# Altium schematic sheet ar_sch.SchDoc
size A4; SheetNumber: 1; SheetTotal: 1
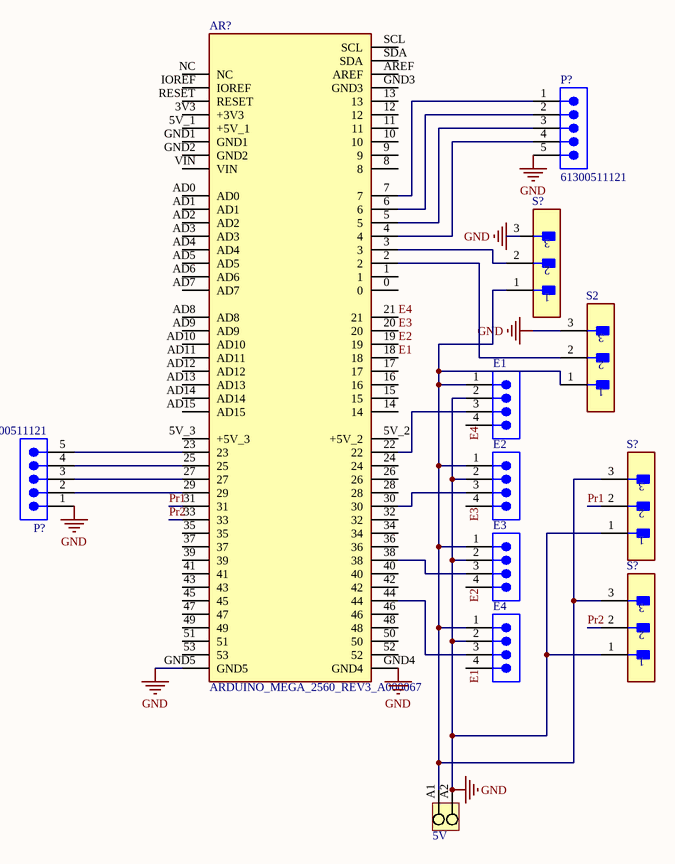
[diagram p0: ar_sch.SchDoc]

## Parts
(Parts that share a designator on the sheet are numbered #1, #2 ... from top to bottom, then left to right.)
5V  1715310000  [LM_5_00_90_02]  (value not drawn)
AR?  ARDUINO_MEGA_2560_REV3_A000067  [MODULE_A000067]
E1  encoder1  [61300411121]  (value not drawn)
E2  encoder2  [61300411121]  (value not drawn)
E3  encoder3  [61300411121]  (value not drawn)
E4  encoder4  [61300411121]  (value not drawn)
P?#1  61300511121  [61300511121]
P?#2  61300511121  [61300511121]
S2  22-11-1031  [FP-0022111031-MFG]  (value not drawn)
S?#1  22-11-1031  [FP-0022111031-MFG]  (value not drawn)
S?#2  22-11-1031  [FP-0022111031-MFG]  (value not drawn)
S?#3  22-11-1031  [FP-0022111031-MFG]  (value not drawn)

## Nets
GND: 5V.A2 AR?.GND4 AR?.GND5 E1.2 E2.2 E3.2 E4.2 P?#1.5 P?#2.1 S2.3 S?#1.3 S?#2.1 S?#3.1
E1: AR?.18 E4.4
E2: AR?.19 E3.4
E3: AR?.20 E2.4
E4: AR?.21 E1.4
Pr1: AR?.31 S?#2.2
Pr2: AR?.33 S?#3.2
Net5V_A1: 5V.A1 E1.1 E2.1 E3.1 E4.1 S2.1 S?#1.1 S?#2.3 S?#3.3
NetAR?_2: AR?.2 S2.2
NetAR?_3: AR?.3 S?#1.2
NetAR?_4: AR?.4 P?#1.4
NetAR?_5: AR?.5 P?#1.3
NetAR?_6: AR?.6 P?#1.2
NetAR?_7: AR?.7 P?#1.1
NetAR?_22: AR?.22 E1.3
NetAR?_23: AR?.23 P?#2.5
NetAR?_25: AR?.25 P?#2.4
NetAR?_27: AR?.27 P?#2.3
NetAR?_29: AR?.29 P?#2.2
NetAR?_30: AR?.30 E2.3
NetAR?_38: AR?.38 E3.3
NetAR?_44: AR?.44 E4.3

Not connected (* = marked no-connect by the designer): AR? 0 1 3V3(+3V3) 5V_1(+5V_1) 5V_2(+5V_2) 5V_3(+5V_3) 8 9 10 11 12 13 14 15 16 17 24 26 28 32 34 35 36 37 39 40 41 42 43 45 46 47 48 49 50 51 52 53 AD0 AD1 AD2 AD3 AD4 AD5 AD6 AD7 AD8 AD9 AD10 AD11 AD12 AD13 AD14 AD15 AREF GND1 GND2 GND3 IOREF NC RESET SCL SDA VIN

## Library data of the parts
5V = CMP-1559-01745-1: OMNIMATE Signal - series LM; Manufacturer: Weidmueller; Contact_material: Cu-Leg; Contact_surface: tinned; Solder_pin_length_mm: 3,5 mm; Rated_voltage_for_surge_voltage_class_pollution_degree_II_2: 630 V; Short_text_for_material: LM 5.00/02/90 3.5SN OR BX; Pitch_inch: 0,197 inch; Pitch_mm: 5 mm; Wire_cross_section_AWG_min_UL_1059: AWG 24; No_of_poles: 2; Side_termination_characteristic: closed side; UL_94_flammability_rating: V-0; Mounting_onto_the_PCB: Solder connection; Rated_voltage_use_group_B_UL_1059: 300 V; Insulating_material: Wemid (PA); Solid_min_H05_07_V_U: 0,2 mm²; Rated_current_use_group_B_UL_1059: 15 A; Wire_cross_section_AWG_max_UL_1059: AWG 14; Solid_max_H05_07_V_U: 2,5 mm²; PartNumber: 1715310000; ComponentLink2Description: URL Link1; Revision: V1; ComponentLink1Description: Manufacturer URL; ComponentLink2URL: http://catalog.weidmueller.com/catalog/Start.do?localeId=en&ObjectID=1715310000; PackageReference: LM_5_00_90_02; Qty: 500 PCS; Colour: Orange; ComponentLink1URL: http://www.weidmueller.com/; Packaging: Box
AR? = ARDUINO_MEGA_2560_REV3_A000067: ATmega2560 Arduino Mega2560 AVRÂ® ATmega AVR MCU 8-Bit Embedded Evaluation Board; MP: ARDUINO MEGA 2560 REV3 ¦ A000067; SnapEDA_Link: https://www.snapeda.com/parts/ARDUINO%20MEGA%202560%20REV3%20%7C%20A000067/Arduino/view-part/?ref=snap; Package: Non-Standard Arduino; Value: *; MF: Arduino; Check_prices: https://www.snapeda.com/parts/ARDUINO%20MEGA%202560%20REV3%20%7C%20A000067/Arduino/view-part/?ref=eda
E1-E4 = CMP-1502-01064-4: THT Vertical Pin Header WR-PHD, Pitch 2.54 mm, Single Row, 4 pins; Connector Type: Male Pin; Gender: Male; Current Rating: 3A; Number of Positions: 4; Operating Supply Voltage: 250V; Contact Resistance: 20mΩ; Pitch: 2.54mm; Max Operating Temperature: 105°C; Mount: Through Hole; Contact Material: Gold; Contact Plating: Gold; Number of Contacts: 4; Orientation: Vertical; Packaging: Bulk; Contact Mating Length: 5.9944mm; Voltage Rating: 250V; Number of Rows: 1; Height: 8.89mm; Lead Free: Lead Free; Lead Pitch: 2.54mm; Number of Pins: 4; Color: Black; Min Operating Temperature: -40°C; RoHS: Compliant; Termination: Solder
P?#1 P?#2 = CMP-1502-01068-4: THT Vertical Pin Header WR-PHD, Pitch 2.54 mm, Single Row, 5 pins; Number of Contacts: 5; Connector Type: Male Pin; Operating Supply Voltage: 250V; Contact Resistance: 20mΩ; Gender: Male; Pitch: 2.54mm; Current Rating: 3A; Min Operating Temperature: -40°C; Contact Material: Gold; Color: Black; RoHS: Compliant; Number of Rows: 1; Lead Free: Lead Free; Height: 8.89mm; Contact Plating: Gold; Number of Pins: 5; Orientation: Vertical; Voltage Rating: 250V; Packaging: Bulk; Number of Positions: 5; Max Operating Temperature: 105°C; Termination: Solder; Lead Pitch: 2.54mm; Contact Mating Length: 5.9944mm; Mount: Through Hole
S2 S?#1-S?#3 = CMP-00257-00247512-1: 22-11-1031 Mini-Latch™ Wire-to-Board Header, Vertical, with Friction Ramp, 3 Circuits, Gold (Au) Plating; Manufacturer Lifecycle Status: ACTIVE; NexarPartId: 247512; Number of Positions: 3; Current Rating: 3A; Gender: Male; Pitch: 2.5mm; Connector Type: Male Pin; Contact Resistance: 20mΩ; Voltage Rating: 250V; Max Voltage Rating (DC): 250.25kV; Color: Natural; Fastening Type: Friction; RoHS: Compliant; Contact Mating Length: 7.493mm; Lifecycle Status: Production; Number of Rows: 1; Schedule B: 8536694040, 8536694040; Radiation Hardening: No; Number of Contacts: 3; Depth: 4.9mm; Termination: Solder; Housing Color: Natural; Max Operating Temperature: 105°C; Mount: Through Hole; Height: 12.1mm; Lead Free: Lead Free; Contact Gender: Male; Plating: Gold; Contact Material: Brass; Length: 7mm; Country of Origin: KR; Housing Material: Nylon; Number of Circuits: 3; Contact Plating: Gold; Packaging: Bulk; Orientation: Vertical; Min Operating Temperature: -40°C; REACH SVHC: Unknown